# Altium schematic sheet 04.Input_Output.SchDoc: 04.Input_Output
size A4; Organization: Altium Limited; Address1: L3, 12a Rodborough Rd; Address2: Frenchs Forest; Address3: NSW; Address4: Australia 2086; SheetNumber: 4; SheetTotal: 4
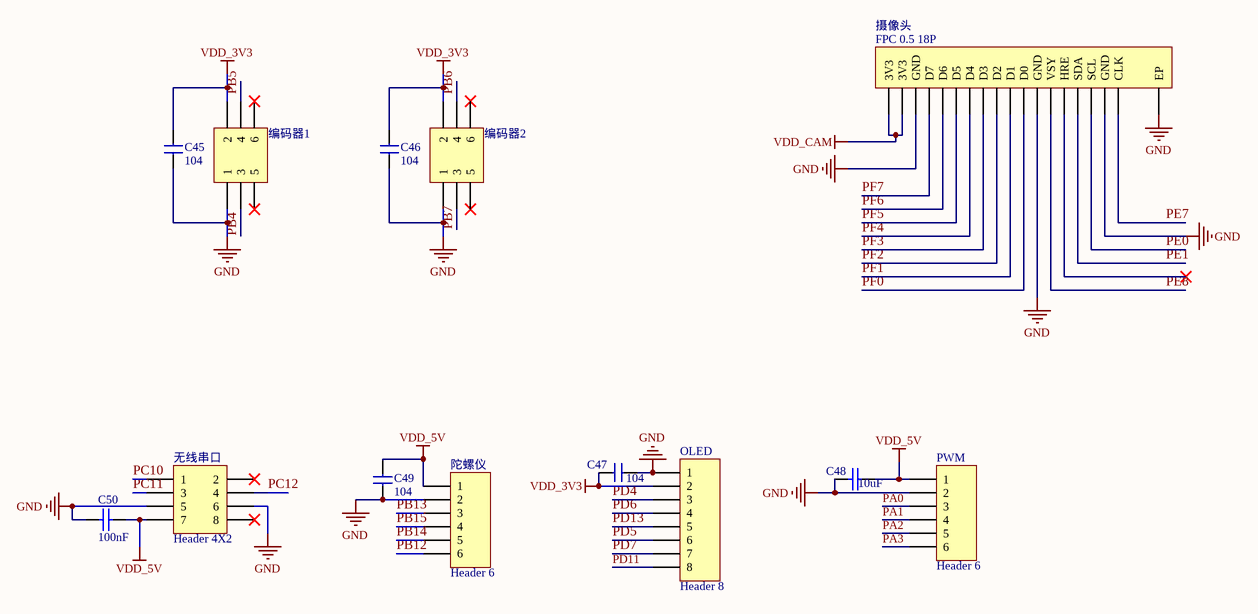
[diagram p0: 04.Input_Output.SchDoc]

## Parts
C45  104  [C0603]
C46  104  [C0603]
C47  104  [C0603]
C48  10UF  [0603 电容 C3]
C49  104  [C0603]
C50  100nF  [0603 电容 C3]
OLED  Header 8  [HDR2.54-LI-8P]
PWM  Header 6  [MX 1.25-WS-6P]
摄像头  FPC 0.5 18P  [FPC0.5 2H-WS-18P]
无线串口  Header 4X2  [HDR2.54-LI-2x4P]
编码器1  Header 3X2  [DC-2.54-L-Z-6P]  (value not drawn)
编码器2  Header 3X2  [DC-2.54-L-Z-6P]  (value not drawn)
陀螺仪  Header 6  [MX 1.25-WS-6P]

## Nets
GND: C45.1 C46.1 C47.2 C48.1 C49.1 C50.2 OLED.1 PWM.2 摄像头.0(EP) 摄像头.3(GND) 摄像头.12(GND) 摄像头.17(GND) 无线串口.5 无线串口.6 编码器1.1 编码器2.1 陀螺仪.2
VDD_3V3: C45.2 C46.2 C47.1 OLED.2 编码器1.2 编码器2.2
VDD_5V: C48.2 C49.2 C50.1 PWM.1 无线串口.7 陀螺仪.1
VDD_CAM: 摄像头.1(3V3) 摄像头.2(3V3)
PA0: PWM.3
PA1: PWM.4
PA2: PWM.5
PA3: PWM.6
PB4: 编码器1.3
PB5: 编码器1.4
PB6: 编码器2.4
PB7: 编码器2.3
PB12: 陀螺仪.6
PB13: 陀螺仪.3
PB14: 陀螺仪.5
PB15: 陀螺仪.4
PC10: 无线串口.1
PC11: 无线串口.3
PC12: 无线串口.4
PD4: OLED.3
PD5: OLED.6
PD6: OLED.4
PD7: OLED.7
PD11: OLED.8
PD13: OLED.5
PE0: 摄像头.16(SCL)
PE1: 摄像头.15(SDA)
PE7: 摄像头.18(CLK)
PE8: 摄像头.13(VSY)
PF0: 摄像头.11(D0)
PF1: 摄像头.10(D1)
PF2: 摄像头.9(D2)
PF3: 摄像头.8(D3)
PF4: 摄像头.7(D4)
PF5: 摄像头.6(D5)
PF6: 摄像头.5(D6)
PF7: 摄像头.4(D7)

Not connected (* = marked no-connect by the designer): 摄像头 14(HRE)*; 无线串口 2* 8*; 编码器1 5* 6*; 编码器2 5* 6*

## Notes on the sheet
- Title：
- Size:
- Project：
- A4
- Date:
- MM32F3277G9P
- Revision:
- V1.0
- Author：
- Haibara
- Sheet:
- of:

## Library data of the parts
C45-C47 C49 = 电容
C48 C50 = Cap: Capacitor; Published: 8-Jun-2000; LatestRevisionDate: 17-Jul-2002; LatestRevisionNote: Re-released for DXP Platform.; PackageReference: RAD-0.3; Publisher: Altium Limited; PackageDescription: Radial Cap, Thru-Hole; 2 Leads; 0.3 in Pin Spacing
  C48: Value: 10uF
OLED = Header 8: Header, 8-Pin; LatestRevisionDate: 17-Jul-2002; LatestRevisionNote: Re-released for DXP Platform.; Publisher: Altium Limited
PWM 陀螺仪 = Header 6: Header, 6-Pin; LatestRevisionDate: 17-Jul-2002; LatestRevisionNote: Re-released for DXP Platform.; Publisher: Altium Limited
摄像头 = 18P Cam: Header, 25-Pin; LatestRevisionDate: 17-Jul-2002; LatestRevisionNote: Re-released for DXP Platform.; Publisher: Altium Limited
无线串口 = Header 4X2: Header, 4-Pin, Dual row; LatestRevisionDate: 17-Jul-2002; LatestRevisionNote: Re-released for DXP Platform.; Publisher: Altium Limited
编码器1 编码器2 = Header 3X2: Header, 3-Pin, Dual row; LatestRevisionDate: 17-Jul-2002; LatestRevisionNote: Re-released for DXP Platform.; Publisher: Altium Limited